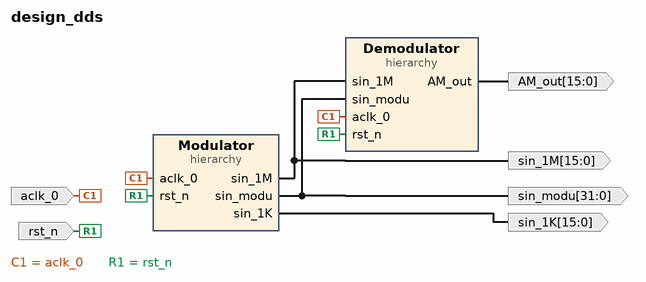
[diagram p0: block diagram of the top level]
# Vivado block design design_dds, xc7z020clg400-2, Vivado 2020.2
create_bd_design design_dds

create_bd_port -dir I -type clk aclk_0
set_property -dict {CONFIG.ASSOCIATED_RESET rst_n CONFIG.FREQ_HZ 100000000} [get_bd_ports aclk_0]
create_bd_port -dir O -from 15 -to 0 sin_1M
create_bd_port -dir I -type rst rst_n
set_property -dict {CONFIG.POLARITY ACTIVE_LOW} [get_bd_ports rst_n]
create_bd_port -dir O -from 15 -to 0 sin_1K
create_bd_port -dir O -from 31 -to 0 -type data sin_modu
create_bd_port -dir O -from 15 -to 0 AM_out

create_bd_cell -type hier Modulator
create_bd_cell -type hier Demodulator

# ---- hierarchy /Modulator ----
current_bd_instance /Modulator
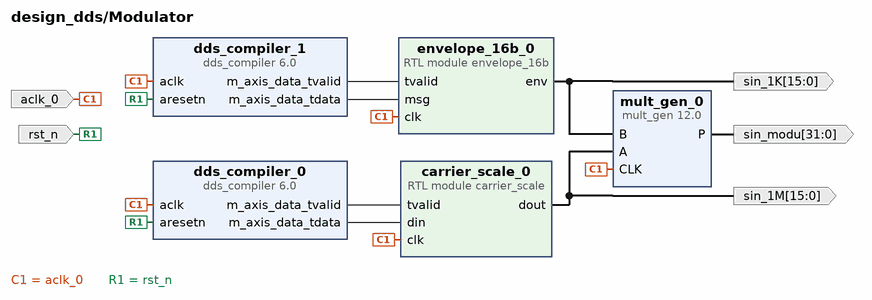
[diagram p1: block diagram inside /Modulator]
create_bd_pin -dir I -type clk aclk_0
create_bd_pin -dir O -from 15 -to 0 -type data sin_1K
create_bd_pin -dir O -from 15 -to 0 -type data sin_1M
create_bd_pin -dir I -type rst rst_n
create_bd_pin -dir O -from 31 -to 0 -type data sin_modu

create_bd_cell -type module -reference envelope_16b envelope_16b_0
create_bd_cell -type ip -vlnv xilinx.com:ip:dds_compiler:6.0 dds_compiler_0
set_property -dict [list \
  CONFIG.Frequency_Resolution 200 \
  CONFIG.Has_ARESETn true \
  CONFIG.Has_Phase_Out false \
  CONFIG.Has_TREADY false \
  CONFIG.Latency 8 \
  CONFIG.M_DATA_Has_TUSER Not_Required \
  CONFIG.Noise_Shaping Auto \
  CONFIG.Output_Frequency1 1 \
  CONFIG.Output_Selection Sine \
  CONFIG.Output_Width 16 \
  CONFIG.PINC1 1010001111010 \
  CONFIG.Phase_Width 19 \
  CONFIG.Spurious_Free_Dynamic_Range 96 \
] [get_bd_cells dds_compiler_0]
create_bd_cell -type ip -vlnv xilinx.com:ip:dds_compiler:6.0 dds_compiler_1
set_property -dict [list \
  CONFIG.Frequency_Resolution 200 \
  CONFIG.Has_ARESETn true \
  CONFIG.Has_Phase_Out false \
  CONFIG.Has_TREADY false \
  CONFIG.Latency 8 \
  CONFIG.M_DATA_Has_TUSER Not_Required \
  CONFIG.Noise_Shaping Auto \
  CONFIG.Output_Frequency1 0.001 \
  CONFIG.Output_Selection Sine \
  CONFIG.Output_Width 16 \
  CONFIG.PINC1 101 \
  CONFIG.Phase_Width 19 \
  CONFIG.Spurious_Free_Dynamic_Range 96 \
] [get_bd_cells dds_compiler_1]
create_bd_cell -type ip -vlnv xilinx.com:ip:mult_gen:12.0 mult_gen_0
set_property -dict [list \
  CONFIG.PortAType Signed \
  CONFIG.PortAWidth 16 \
  CONFIG.PortBType Signed \
  CONFIG.PortBWidth 16 \
  CONFIG.Use_Custom_Output_Width false \
] [get_bd_cells mult_gen_0]
create_bd_cell -type module -reference carrier_scale carrier_scale_0

# ---- hierarchy /Demodulator ----
current_bd_instance /Demodulator
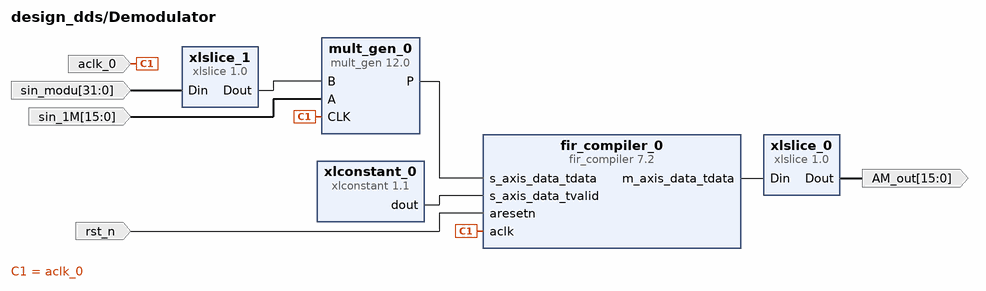
[diagram p2: block diagram inside /Demodulator]
create_bd_pin -dir I -type clk aclk_0
create_bd_pin -dir I -from 15 -to 0 -type data sin_1M
create_bd_pin -dir I -type rst rst_n
create_bd_pin -dir I -from 31 -to 0 -type data sin_modu
create_bd_pin -dir O -from 15 -to 0 AM_out

create_bd_cell -type ip -vlnv xilinx.com:ip:mult_gen:12.0 mult_gen_0
set_property -dict {CONFIG.PortAWidth 16 CONFIG.PortBWidth 16} [get_bd_cells mult_gen_0]
create_bd_cell -type ip -vlnv xilinx.com:ip:fir_compiler:7.2 fir_compiler_0
set_property -dict [list \
  CONFIG.Clock_Frequency 100 \
  CONFIG.CoefficientSource COE_File \
  CONFIG.Coefficient_File ../../../../../../coh_fir_v2.coe \
  CONFIG.Coefficient_Fractional_Bits 0 \
  CONFIG.Coefficient_Sets 1 \
  CONFIG.Coefficient_Sign Signed \
  CONFIG.Coefficient_Structure Inferred \
  CONFIG.Coefficient_Width 18 \
  CONFIG.ColumnConfig 60,5 \
  CONFIG.Data_Fractional_Bits 0 \
  CONFIG.Data_Width 32 \
  CONFIG.Filter_Architecture Systolic_Multiply_Accumulate \
  CONFIG.Has_ARESETn true \
  CONFIG.Output_Rounding_Mode Full_Precision \
  CONFIG.Output_Width 48 \
  CONFIG.Quantization Integer_Coefficients \
  CONFIG.Sample_Frequency 100 \
] [get_bd_cells fir_compiler_0]
create_bd_cell -type ip -vlnv xilinx.com:ip:xlconstant:1.1 xlconstant_0
create_bd_cell -type ip -vlnv xilinx.com:ip:xlslice:1.0 xlslice_1
set_property -dict {CONFIG.DIN_FROM 31 CONFIG.DIN_TO 16 CONFIG.DOUT_WIDTH 16} [get_bd_cells xlslice_1]
create_bd_cell -type ip -vlnv xilinx.com:ip:xlslice:1.0 xlslice_0
set_property -dict {CONFIG.DIN_FROM 47 CONFIG.DIN_TO 32 CONFIG.DIN_WIDTH 48 CONFIG.DOUT_WIDTH 16} [get_bd_cells xlslice_0]

# ---- connections ----

current_bd_instance /Modulator
connect_bd_net [get_bd_pins dds_compiler_1/m_axis_data_tvalid] [get_bd_pins envelope_16b_0/tvalid]
connect_bd_net -net dds_compiler_0_m_axis_data_tdata [get_bd_pins dds_compiler_1/m_axis_data_tdata] [get_bd_pins envelope_16b_0/msg]
connect_bd_net [get_bd_pins dds_compiler_0/m_axis_data_tvalid] [get_bd_pins carrier_scale_0/tvalid]
connect_bd_net -net dds_compiler_1_m_axis_data_tdata [get_bd_pins dds_compiler_0/m_axis_data_tdata] [get_bd_pins carrier_scale_0/din]
connect_bd_net -net aclk_0_1 [get_bd_pins aclk_0] \
  [get_bd_pins dds_compiler_0/aclk] [get_bd_pins dds_compiler_1/aclk] [get_bd_pins mult_gen_0/CLK] \
  [get_bd_pins envelope_16b_0/clk] [get_bd_pins carrier_scale_0/clk]
connect_bd_net [get_bd_pins envelope_16b_0/env] [get_bd_pins sin_1K] [get_bd_pins mult_gen_0/B]
connect_bd_net [get_bd_pins carrier_scale_0/dout] [get_bd_pins sin_1M] [get_bd_pins mult_gen_0/A]
connect_bd_net [get_bd_pins rst_n] [get_bd_pins dds_compiler_1/aresetn] [get_bd_pins dds_compiler_0/aresetn]
connect_bd_net [get_bd_pins mult_gen_0/P] [get_bd_pins sin_modu]

current_bd_instance /Demodulator
connect_bd_net [get_bd_pins xlslice_1/Dout] [get_bd_pins mult_gen_0/B]
connect_bd_net [get_bd_pins mult_gen_0/P] [get_bd_pins fir_compiler_0/s_axis_data_tdata]
connect_bd_net [get_bd_pins xlconstant_0/dout] [get_bd_pins fir_compiler_0/s_axis_data_tvalid]
connect_bd_net -net aclk_0_1 [get_bd_pins aclk_0] [get_bd_pins fir_compiler_0/aclk] [get_bd_pins mult_gen_0/CLK]
connect_bd_net -net carrier_scale_0_dout [get_bd_pins sin_1M] [get_bd_pins mult_gen_0/A]
connect_bd_net [get_bd_pins rst_n] [get_bd_pins fir_compiler_0/aresetn]
connect_bd_net -net mult_gen_0_P [get_bd_pins sin_modu] [get_bd_pins xlslice_1/Din]
connect_bd_net [get_bd_pins xlslice_0/Dout] [get_bd_pins AM_out]
connect_bd_net [get_bd_pins fir_compiler_0/m_axis_data_tdata] [get_bd_pins xlslice_0/Din]

current_bd_instance /
connect_bd_net -net aclk_0_1 [get_bd_ports aclk_0] [get_bd_pins Modulator/aclk_0] [get_bd_pins Demodulator/aclk_0]
connect_bd_net [get_bd_ports rst_n] [get_bd_pins Modulator/rst_n] [get_bd_pins Demodulator/rst_n]
connect_bd_net -net envelope_16b_0_env [get_bd_pins Modulator/sin_1K] [get_bd_ports sin_1K]
connect_bd_net -net carrier_scale_0_dout [get_bd_pins Modulator/sin_1M] [get_bd_ports sin_1M] [get_bd_pins Demodulator/sin_1M]
connect_bd_net -net mult_gen_0_P [get_bd_pins Modulator/sin_modu] [get_bd_ports sin_modu] [get_bd_pins Demodulator/sin_modu]
connect_bd_net -net xlslice_0_Dout [get_bd_pins Demodulator/AM_out] [get_bd_ports AM_out]

validate_bd_design
save_bd_design
